# Altium schematic sheet BatterySentinel-N2K-Orion-R5-Logic.SchDoc
size A2
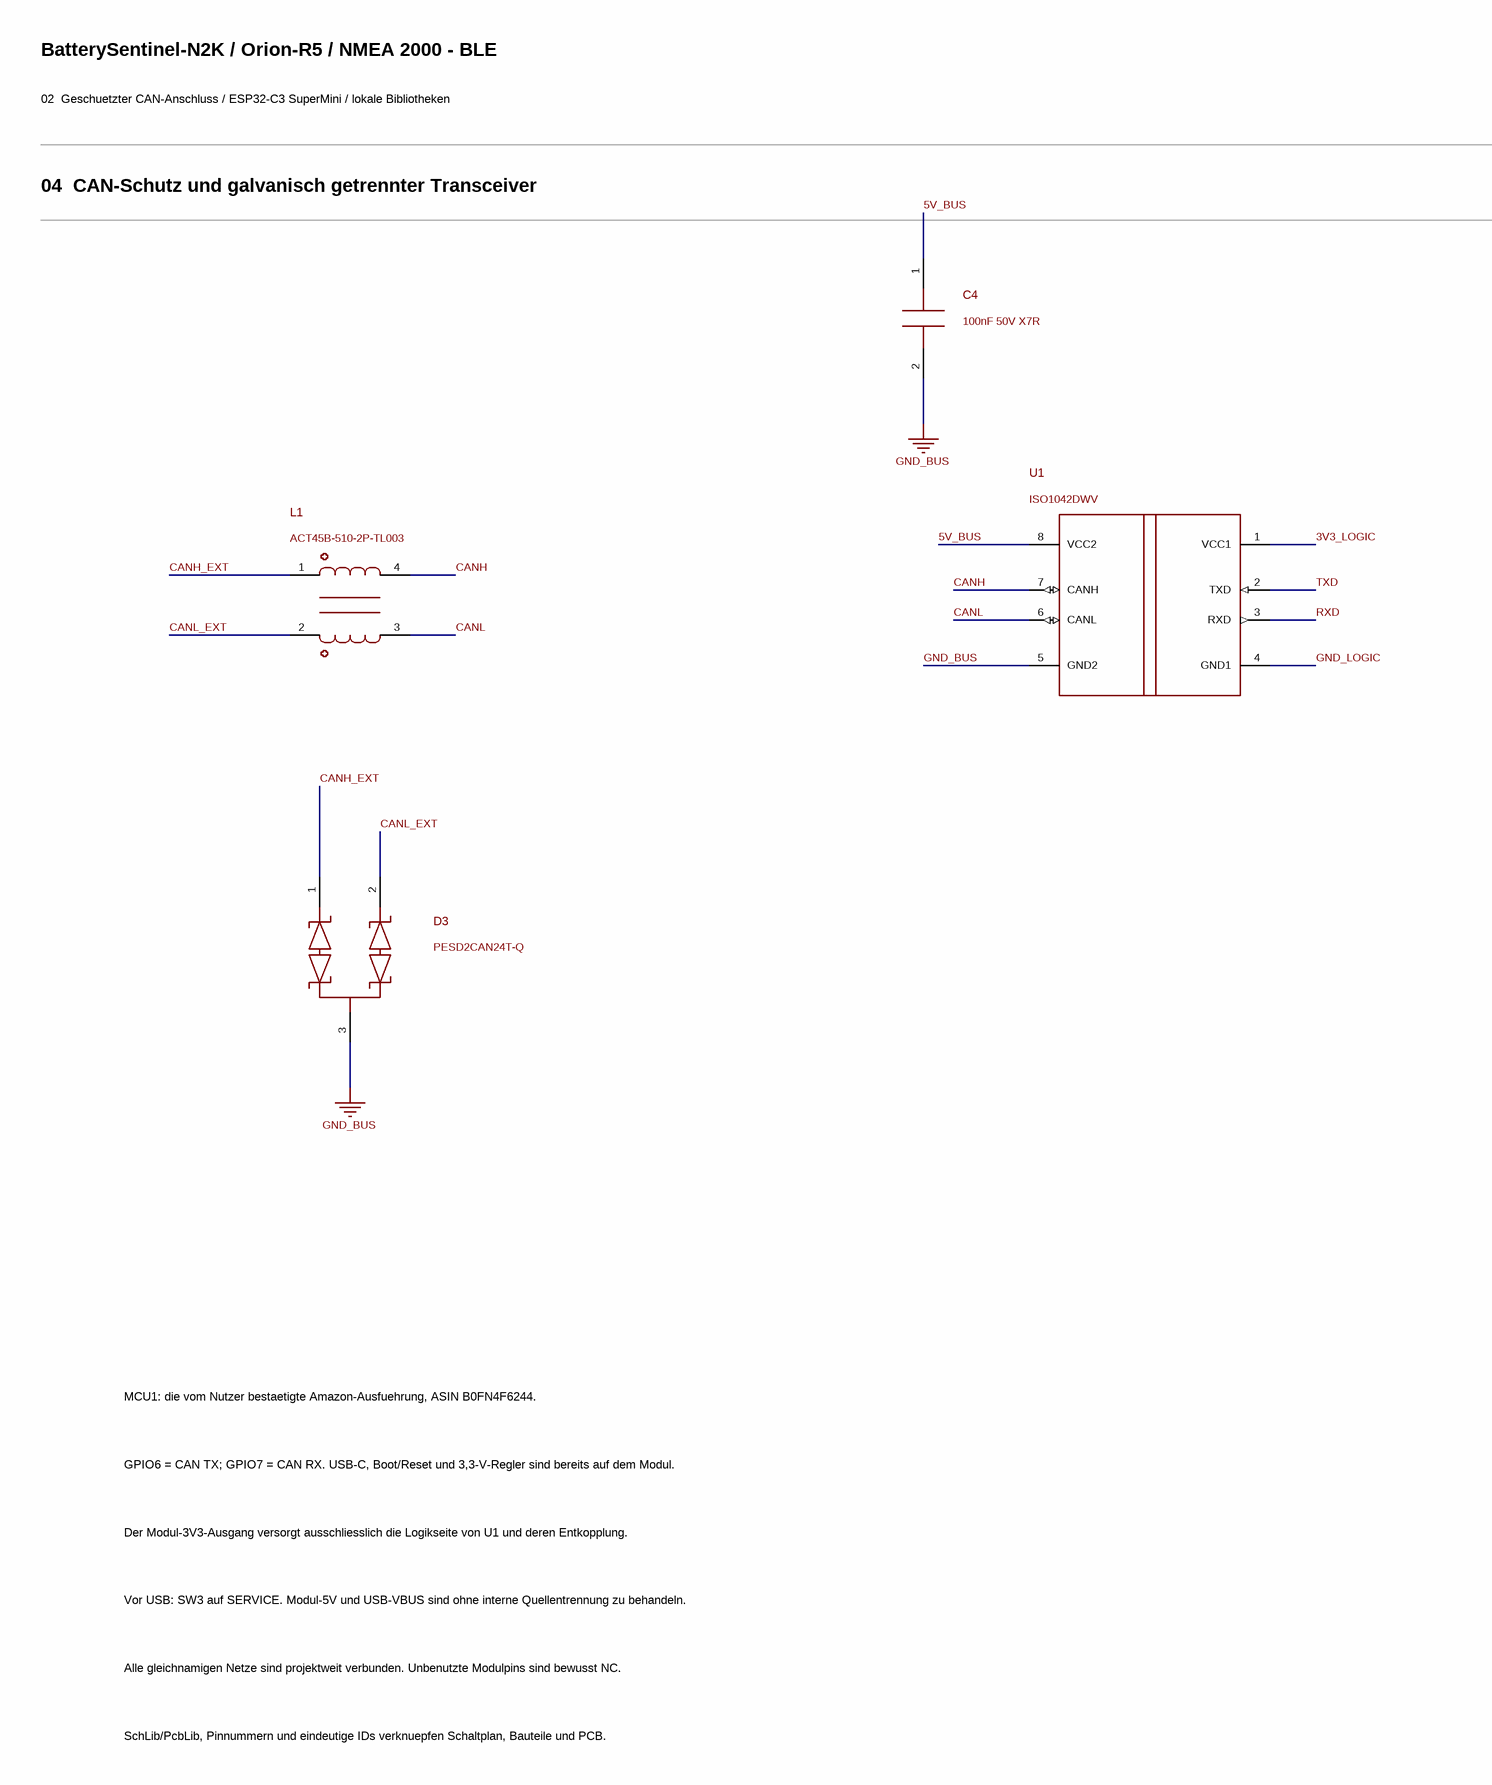
[diagram p0: BatterySentinel-N2K-Orion-R5-Logic.SchDoc, left]
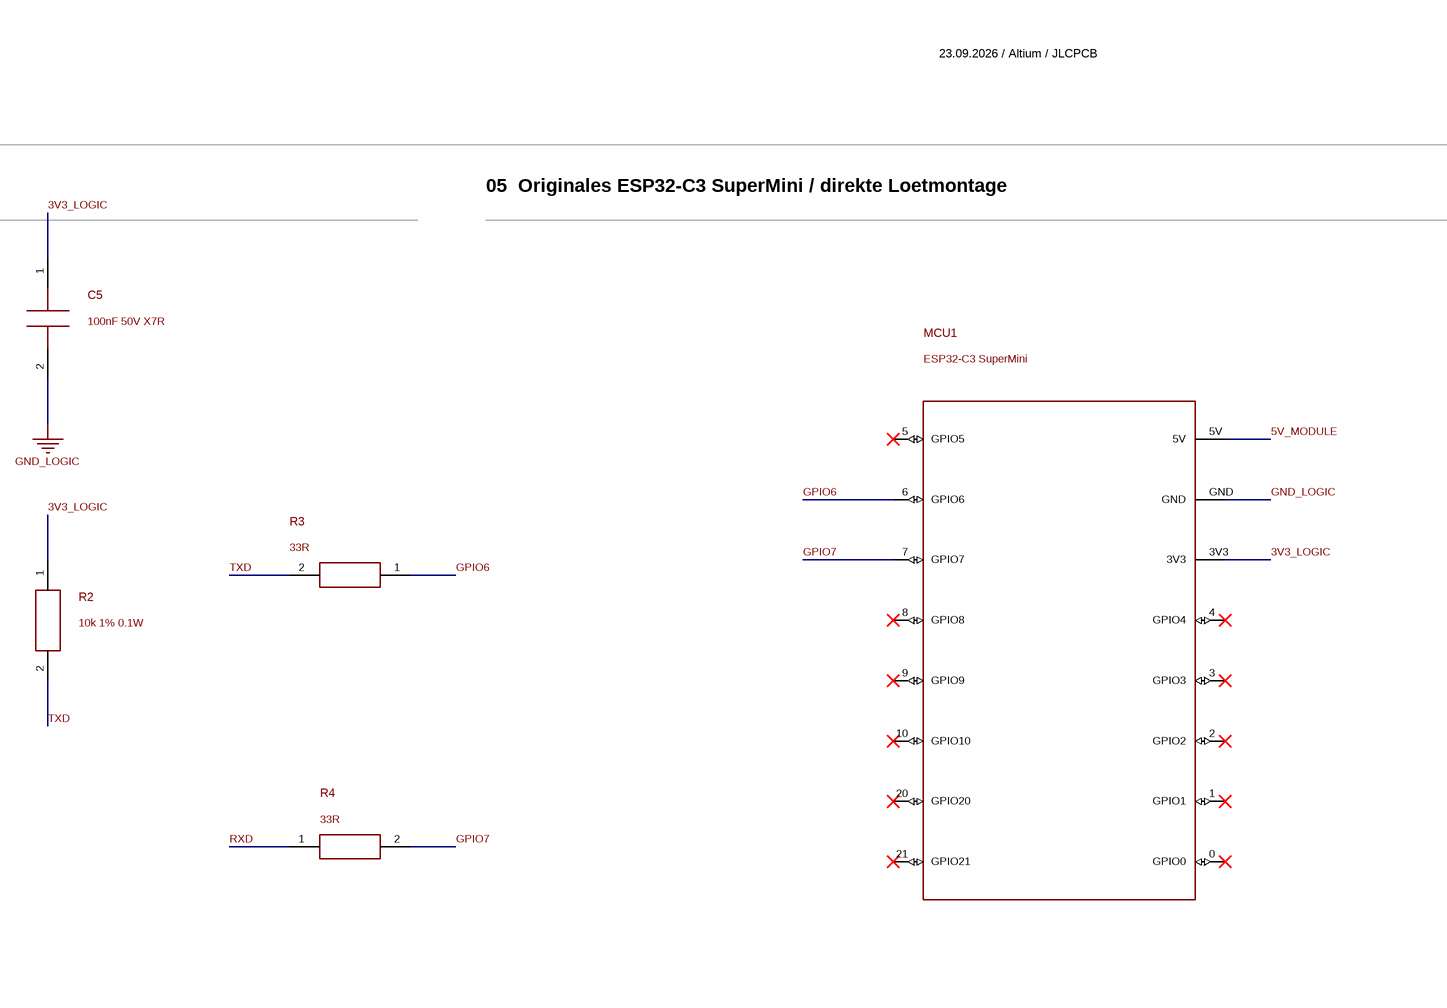
[diagram p1: BatterySentinel-N2K-Orion-R5-Logic.SchDoc, right]

## Parts
C4  100nF 50V X7R  [C0603]
C5  100nF 50V X7R  [C0603]
D3  PESD2CAN24T-Q  [SOT23_NEXPERIA_REFLOW]
L1  ACT45B-510-2P-TL003  [ACT45B]
MCU1  ESP32-C3 SuperMini  [SUPERC3_B0FN4F6244_CAST16_SMD]
R2  10k 1% 0.1W  [R0603]
R3  33R  [R0603]
R4  33R  [R0603]
U1  ISO1042DWV  [SOIC8_DWV]

## Nets
GND_BUS: C4.2 D3.3(CC) U1.5(GND2)
GND_LOGIC: C5.2 MCU1.GND U1.4(GND1)
3V3_LOGIC: C5.1 MCU1.3V3 R2.1 U1.1(VCC1)
5V_BUS: C4.1 U1.8(VCC2)
5V_MODULE: MCU1.5V
CANH: L1.4(H_IC) U1.7(CANH)
CANH_EXT: D3.1(K1) L1.1(H_EXT)
CANL: L1.3(L_IC) U1.6(CANL)
CANL_EXT: D3.2(K2) L1.2(L_EXT)
GPIO6: MCU1.6(GPIO6) R3.1
GPIO7: MCU1.7(GPIO7) R4.2
RXD: R4.1 U1.3(RXD)
TXD: R2.2 R3.2 U1.2(TXD)

Not connected (* = marked no-connect by the designer): MCU1 0(GPIO0)* 1(GPIO1)* 2(GPIO2)* 3(GPIO3)* 4(GPIO4)* 5(GPIO5)* 8(GPIO8)* 9(GPIO9)* 10(GPIO10)* 20(GPIO20)* 21(GPIO21)*

## Notes on the sheet
- BatterySentinel-N2K / Orion-R5 / NMEA 2000 - BLE
- 23.09.2026 / Altium / JLCPCB
- 02  Geschuetzter CAN-Anschluss / ESP32-C3 SuperMini / lokale Bibliotheken
- 04  CAN-Schutz und galvanisch getrennter Transceiver
- 05  Originales ESP32-C3 SuperMini / direkte Loetmontage
- MCU1: die vom Nutzer bestaetigte Amazon-Ausfuehrung, ASIN B0FN4F6244.
- GPIO6 = CAN TX; GPIO7 = CAN RX. USB-C, Boot/Reset und 3,3-V-Regler sind bereits auf dem Modul.
- Der Modul-3V3-Ausgang versorgt ausschliesslich die Logikseite von U1 und deren Entkopplung.
- Vor USB: SW3 auf SERVICE. Modul-5V und USB-VBUS sind ohne interne Quellentrennung zu behandeln.
- Alle gleichnamigen Netze sind projektweit verbunden. Unbenutzte Modulpins sind bewusst NC.
- SchLib/PcbLib, Pinnummern und eindeutige IDs verknuepfen Schaltplan, Bauteile und PCB.

## Library data of the parts
C4 = R5_C4_100nF: 100nF 16V X7R - generic specification; manufacturer/MPN not selected; Manufacturer: YAGEO; MPN: CC0603KRX7R9BB104; ReviewStatus: R5 placement with enclosure interface; Manufacturer Part Number: CC0603KRX7R9BB104; Datasheet: https://www.lcsc.com/datasheet/lcsc_datasheet_2211101700_YAGEO-CC0603KRX7R9BB104_C14663.pdf; Supplier 1: LCSC; Supplier Part Number 1: C14663; Footprint Status: R5 placement with enclosure interface
C5 = R5_C5_100nF: 100nF 16V X7R - generic specification; manufacturer/MPN not selected; Manufacturer: YAGEO; MPN: CC0603KRX7R9BB104; ReviewStatus: R5 placement with enclosure interface; Manufacturer Part Number: CC0603KRX7R9BB104; Datasheet: https://www.lcsc.com/datasheet/lcsc_datasheet_2211101700_YAGEO-CC0603KRX7R9BB104_C14663.pdf; Supplier 1: LCSC; Supplier Part Number 1: C14663; Footprint Status: R5 placement with enclosure interface
D3 = R5_D3_PESD2CAN24T_Q: Manufacturer: Nexperia; MPN: PESD2CAN24T-QR; ReviewStatus: R5 placement with enclosure interface; Manufacturer Part Number: PESD2CAN24T-QR; Description: PESD2CAN24T-Q; Datasheet: https://assets.nexperia.com/documents/data-sheet/PESD2CAN24T-Q.pdf; Supplier 1: LCSC; Supplier Part Number 1: C28933048; Footprint Status: R5 placement with enclosure interface
L1 = R5_L1_ACT45B_510_2P_TL003: Manufacturer: TDK; ReviewStatus: R5 placement with enclosure interface; MPN: ACT45B-510-2P-TL003; Manufacturer Part Number: ACT45B-510-2P-TL003; Description: ACT45B-510-2P-TL003; Datasheet: https://www.lcsc.com/datasheet/lcsc_datasheet_1811151430_TDK-ACT45B-510-2P-TL003_C76584.pdf; Supplier 1: LCSC; Supplier Part Number 1: C76584; Footprint Status: R5 placement with enclosure interface
MCU1 = R5_MCU1_ESP32_C3: User-selected C3 SuperMini; original onboard USB/BOOT/RESET; direct castellated solder mounting; Manufacturer: Meshnology (seller brand; OEM undisclosed); MPN: ESP32-C3 SuperMini / ASIN B0FN4F6244; ReviewStatus: R5 placement with enclosure interface; Manufacturer Part Number: ESP32-C3 SuperMini / ASIN B0FN4F6244; Datasheet: https://www.amazon.de/4PCS-Supermini-ESP32-C3-Entwicklungsboard/dp/B0FN4F6244; Footprint Status: R5 placement with enclosure interface
R2 = R5_R2_10k: 10k - generic specification; manufacturer/MPN not selected; Manufacturer: UNI-ROYAL(Uniroyal Elec); MPN: 0603WAF1002T5E; ReviewStatus: R5 placement with enclosure interface; Manufacturer Part Number: 0603WAF1002T5E; Datasheet: https://www.lcsc.com/datasheet/lcsc_datasheet_2206010045_UNI-ROYAL-Uniroyal-Elec-0603WAF1002T5E_C25804.pdf; Supplier 1: LCSC; Supplier Part Number 1: C25804; Footprint Status: R5 placement with enclosure interface
R3 = R5_R3_33R: 33R - generic specification; manufacturer/MPN not selected; Manufacturer: UNI-ROYAL(Uniroyal Elec); MPN: 0603WAF330JT5E; Role: R_TX; ReviewStatus: R5 placement with enclosure interface; Manufacturer Part Number: 0603WAF330JT5E; Datasheet: https://www.lcsc.com/datasheet/lcsc_datasheet_2206010116_UNI-ROYAL-Uniroyal-Elec-0603WAF330JT5E_C23140.pdf; Supplier 1: LCSC; Supplier Part Number 1: C23140; Footprint Status: R5 placement with enclosure interface
R4 = R5_R4_33R: 33R - generic specification; manufacturer/MPN not selected; Manufacturer: UNI-ROYAL(Uniroyal Elec); MPN: 0603WAF330JT5E; Role: R_RX; ReviewStatus: R5 placement with enclosure interface; Manufacturer Part Number: 0603WAF330JT5E; Datasheet: https://www.lcsc.com/datasheet/lcsc_datasheet_2206010116_UNI-ROYAL-Uniroyal-Elec-0603WAF330JT5E_C23140.pdf; Supplier 1: LCSC; Supplier Part Number 1: C23140; Footprint Status: R5 placement with enclosure interface
U1 = R5_U1_ISO1042DWV: Manufacturer: Texas Instruments; MPN: ISO1042DWVR; ReviewStatus: R5 placement with enclosure interface; Manufacturer Part Number: ISO1042DWVR; Description: ISO1042DWV; Datasheet: https://datasheet.lcsc.com/lcsc/2302212001_Texas-Instruments-ISO1042DWVR_C2671714.pdf; Supplier 1: LCSC; Supplier Part Number 1: C2671714; Footprint Status: R5 placement with enclosure interface